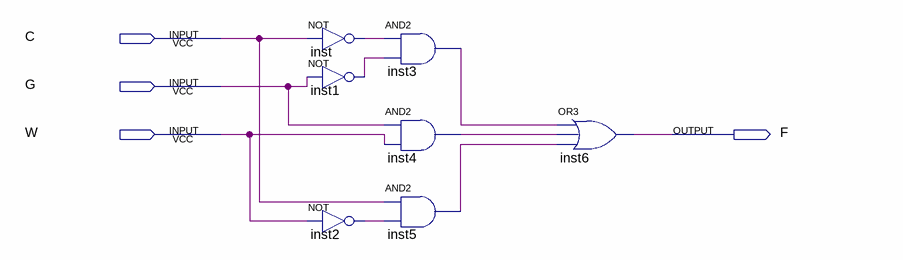
[diagram p0: schematic sheet]
// Quartus schematic lab2step2.bdf as structural Verilog: 7 symbols, 4 pins
module lab2step2 (
  input  C,
  input  G,
  input  W,
  output F
);

  wire inst1_out, inst2_out, inst3_out, inst4_out, inst5_out, inst_out;

  not inst (inst_out, C);
  not inst1 (inst1_out, G);
  not inst2 (inst2_out, W);
  and inst3 (inst3_out, inst_out, inst1_out);
  and inst4 (inst4_out, G, W);
  and inst5 (inst5_out, C, inst2_out);
  or inst6 (F, inst3_out, inst4_out, inst5_out);
endmodule
